# EAGLE design DockConnector (EAGLE 9.6.2)
SCHEMATIC_VERSION: V0.1
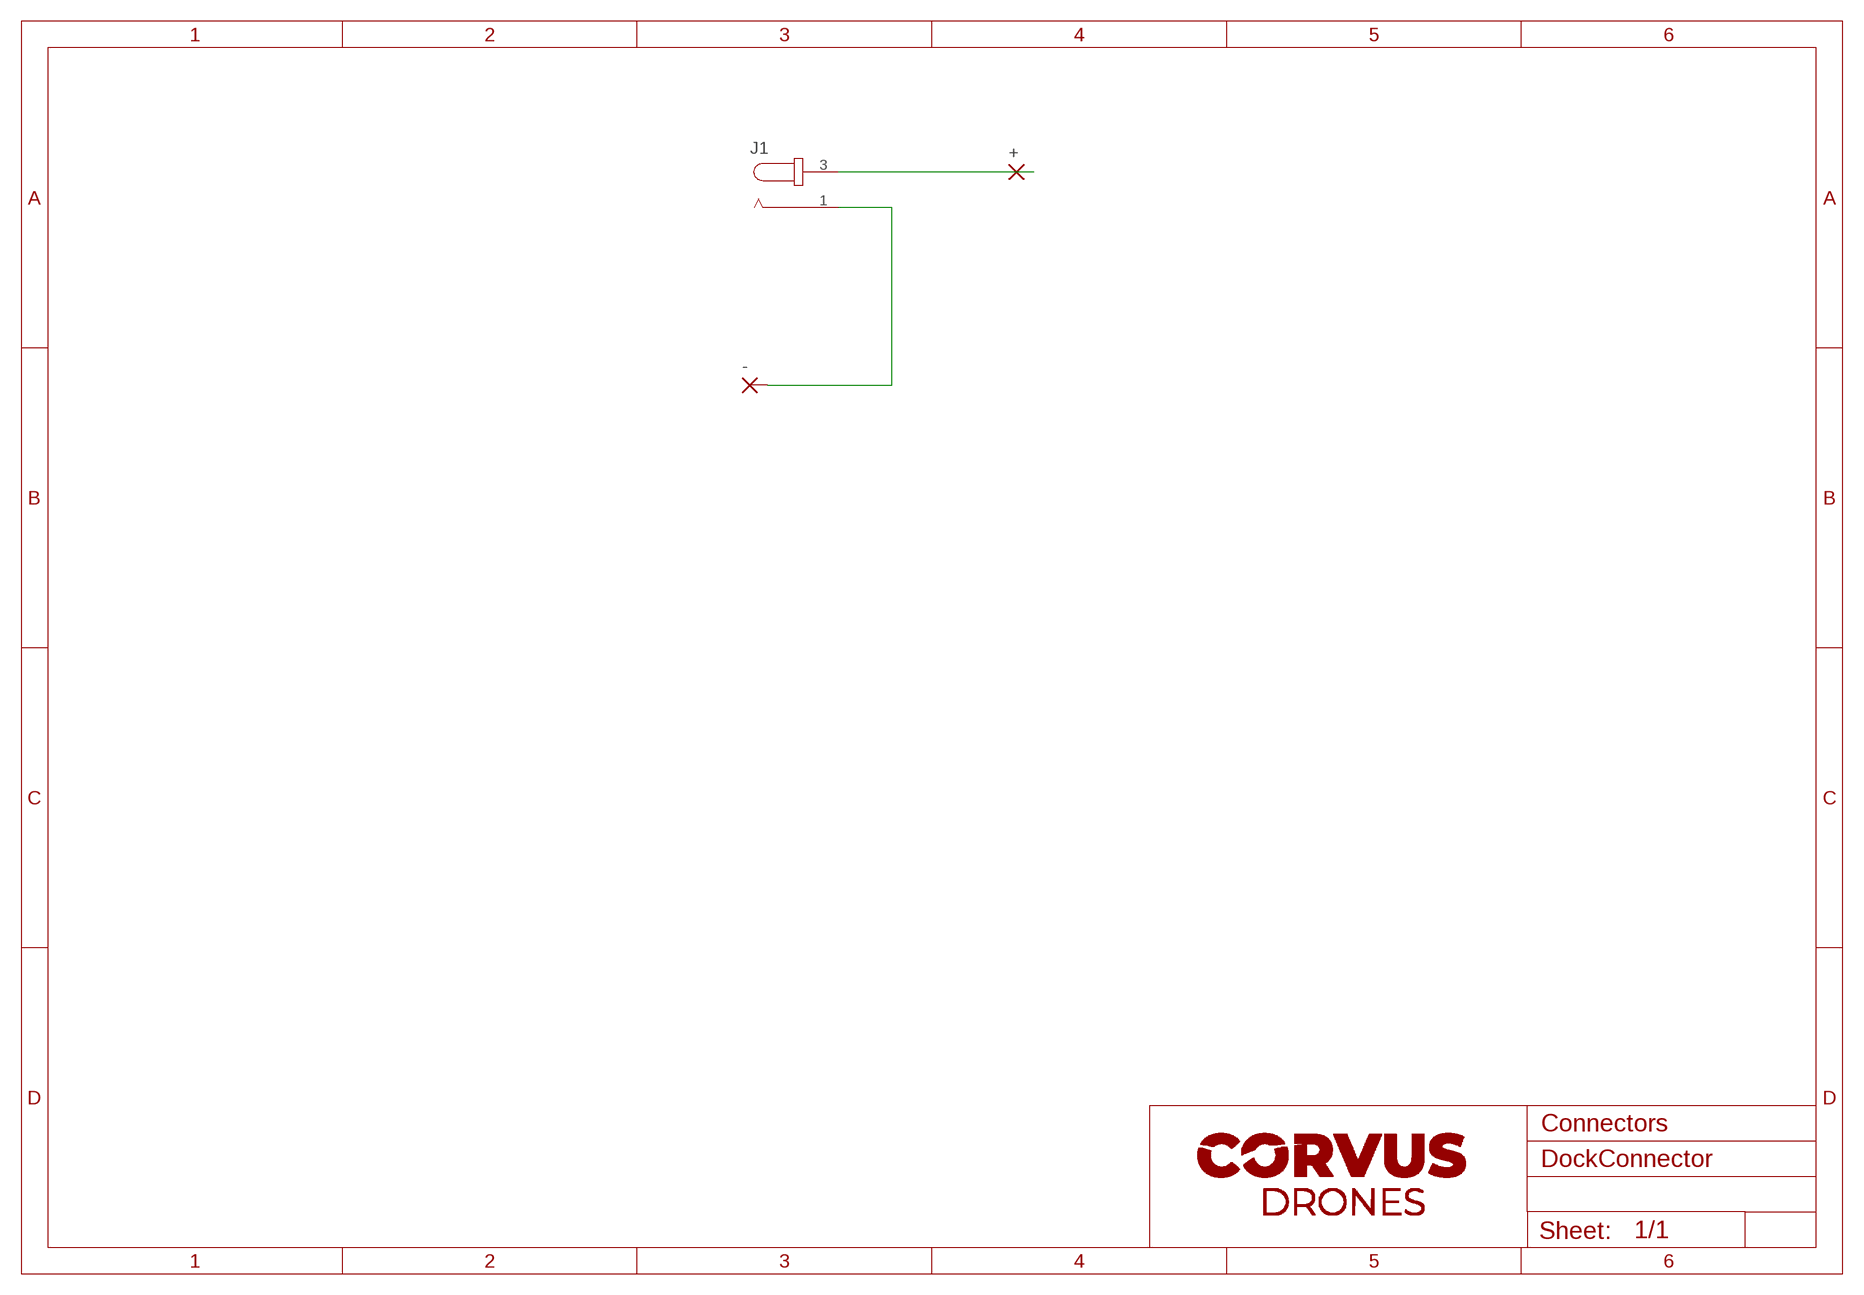
[diagram p0: schematic, sheet 1]

## Parts
+  WIREPAD_2,54/1,1  [WIREPAD_2,54/1,1]
-  WIREPAD_2,54/1,1  [WIREPAD_2,54/1,1]
J1  CON-JACK_JACK-PLUG0  [CON-JACK_SPC4077]

## Nets
N$2: +.1(P) J1.3
N$3: -.1(P) J1.1

## Library data of the parts
+ - = OnTopCharger:WIREPAD_2,54/1,1: THROUGH-HOLE PAD
J1 = OnTopCharger:CON-JACK_JACK-PLUG: DC POWER JACK Power Jack, DC, Right Angle, Through Hole, Rated 5A at 16VDC, PC Terminals Distributor: Farnell (www.Farnell.de) Drawing: 84N1161.pdf / 84N1162.pdf Manufacturer: SPC Technology (www.spctechnology.com) Type: SPC4077 / SPC 4078; OC_FARNELL: unknown; OC_NEWARK: unknown

## Board
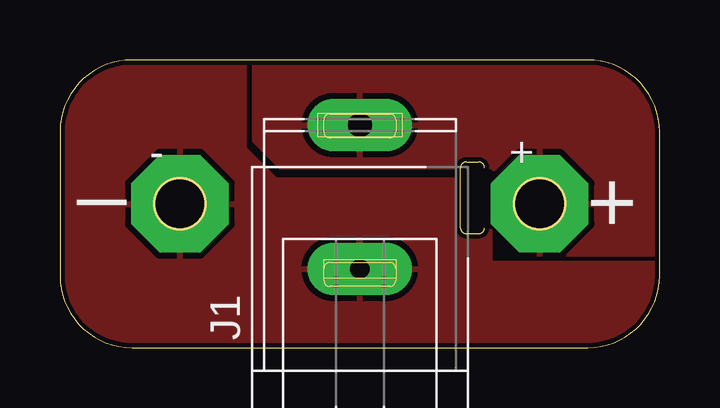
[diagram p1: board, top side]
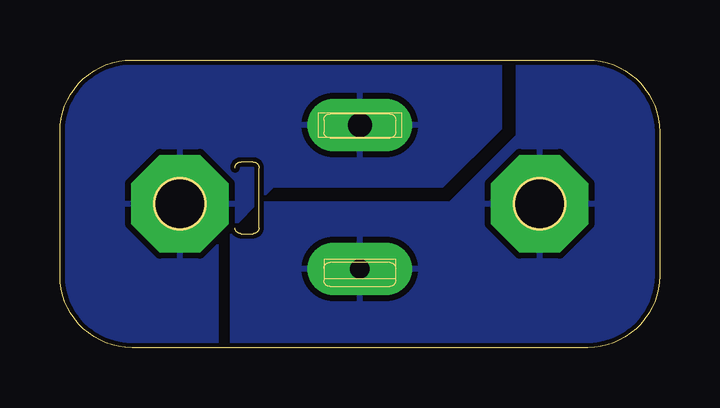
[diagram p2: board, bottom side, seen from below]

Size 25 x 12 mm. Coordinates in mm from the lower left corner, seen from the top.
Outline: 17.7,5 arc-90 17.45,4.75 16.95,4.75 arc-90 16.7,5 16.7,7.5 arc-90 16.95,7.75 17.45,7.75 arc-90 17.7,7.5
Outline: 11.25,9.75 arc90 11,9.5 11,9 arc90 11.25,8.75 13.75,8.75 arc90 14,9 14,9.5 arc90 13.75,9.75 11.25,9.75
Outline: 11,2.8 arc90 11.25,2.55 13.75,2.55 arc90 14,2.8 14,3.3 arc90 13.75,3.55 11.25,3.55 arc90 11,3.3 11,2.8
Outline: 22,0 arc90 25,3 25,9 arc90 22,12 3,12 arc90 0,9 0,3 arc90 3,0 22,0
Outline: circle at 5,6 radius 1.07
Outline: circle at 20,6 radius 1.07
Copper layers (1*16): Top 0.035mm / dielectric 1.6mm / Bottom 0.035mm
Design rules "jlcpcb-2layers_Corvus": minimum track width 5mil, minimum drill 0.3mm, track to track 5mil, track to pad 5mil, pad to pad 5mil, via to via 5mil, smd to smd 5mil, copper to edge 0.2mm, drill to drill 6mil, minimum pad ring 10mil, minimum via ring 3mil, stop-mask expansion 4mil, vias tented up to drill 0.35mm, thermal gap 10mil

### Footprints (pad centres in the part's own frame; a part is rotated, then mirrored left to right if it is on the bottom)
WIREPAD_2,54/1,1 = drill 2.134 pad 4.064 octagon: 1 0,0
CON-JACK_SPC4077 = drill 0.8 pad 2.184 long: 1 -3,0 | drill 1 pad 2.184 long: 3 3,0

### Placement (x,y rotation side)
+  20,6 0 top
-  5,6 0 top
J1  12.5,6.28 90 top

### Tracks (layer width: path | path; a pad name or v marks a point on that pad's centre or on a via)
N$2
  pour Top: 8.08,12.42 8.08,8.61 9.17,7.52 17.99,7.52 18.72,6.78 18.72,3.89 18.75,3.86 26.6,3.86 26.65,3.81 26.65,13.74 26.7,13.79 10.11,13.79 9.88,13.57
  pour Bottom: 6.63,13.13 6.63,9.15 9.05,6.73 16.11,6.73 18.37,4.47 18.44,4.4 18.44,-0.94 30.18,-0.94 30.89,-1.65 30.89,13.11 30.05,13.95 28.78,15.22 10.82,15.22
N$3
  pour Top: -1.01,-1.5 1.02,-3.53 25.81,-3.53 25.81,3.46 25.91,3.56 18.01,3.56 17.96,3.61 17.96,6.66 17.68,6.94 17.58,7.04 9.02,7.04 7.72,8.33 7.72,12.42 -0.3,12.42 -0.38,12.35 -0.38,0.38 -0.81,-0.05
  pour Bottom: -0.99,12.85 -0.99,-1.78 -0.17,-2.59 17.53,-2.59 17.83,-2.89 17.83,5.97 17.78,6.02 8.74,6.02 5.92,8.84 5.92,13.36 5.95,13.39 3.74,13.39 3.48,13.64

### Text on the board
tPlace: _ | +